# EAGLE schematic arduino shield (1) (EAGLE 7.4.0)
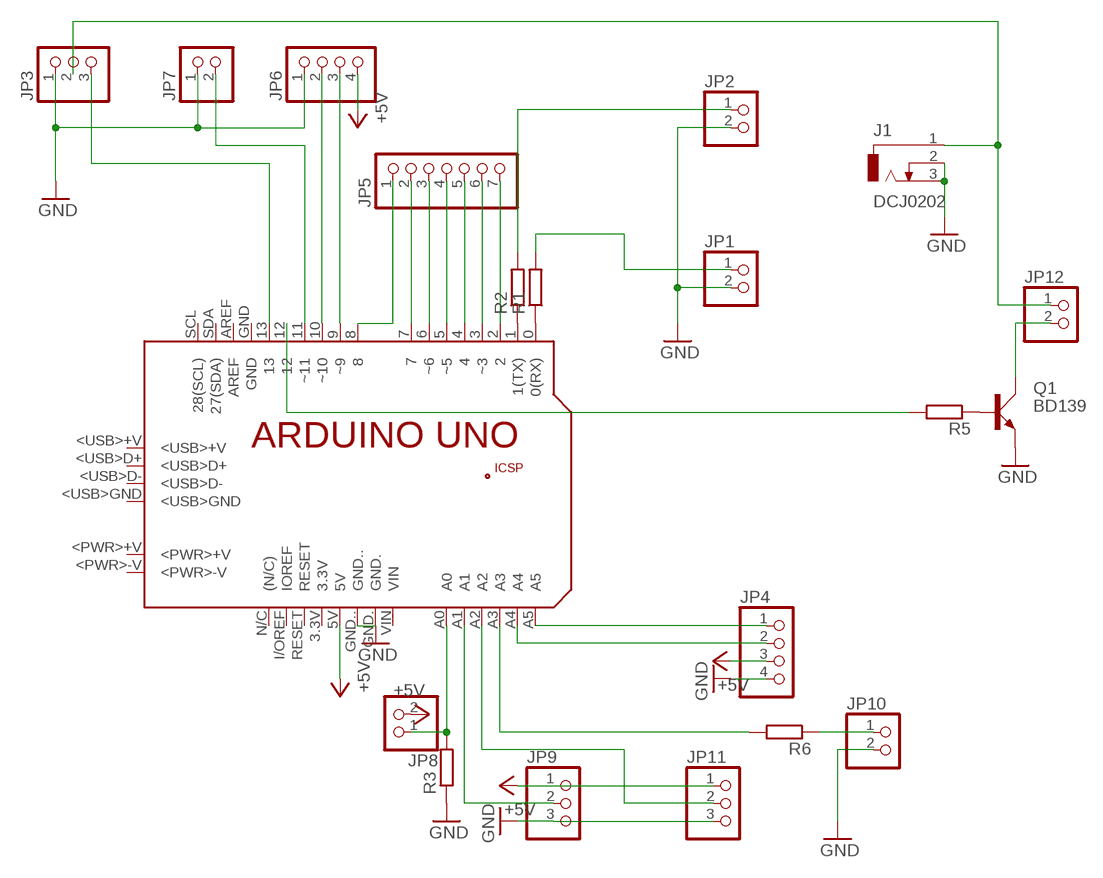
[diagram p0: schematic, sheet 1]

## Parts
J1  DCJ0202  [DCJ0202]
JP1  PINHD-1X2  [1X02]
JP2  PINHD-1X2  [1X02]
JP3  PINHD-1X3  [1X03]
JP4  PINHD-1X4  [1X04]
JP5  PINHD-1X7  [1X07]
JP6  PINHD-1X4  [1X04]
JP7  PINHD-1X2  [1X02]
JP8  PINHD-1X2  [1X02]
JP9  PINHD-1X3  [1X03]
JP10  PINHD-1X2  [1X02]
JP11  PINHD-1X3  [1X03]
JP12  PINHD-1X2  [1X02]
PCB1  ARDUINO_UNO  [ARDUINO_UNO]
Q1  BD139  [TO126AV]
R1  R-EU_0207/7  [0207/7]
R2  R-EU_0207/7  [0207/7]
R3  R-EU_0207/7  [0207/7]
R5  R-EU_0207/7  [0207/7]
R6  R-EU_0207/7  [0207/7]

## Nets
+5V: JP4.3 JP6.4 JP8.2 JP9.1 JP11.1 PCB1.5V
GND: J1.2 J1.3 JP1.2 JP2.2 JP3.1 JP4.4 JP6.1 JP7.1 JP9.3 JP10.2 JP11.3 PCB1.GND. PCB1.GND.. Q1.E R3.1
N$1: PCB1.0(0(RX)) R1.1
N$2: PCB1.1(1(TX)) R2.1
N$3: JP5.7 PCB1.2
N$4: JP5.6 PCB1.3(~3)
N$5: JP5.5 PCB1.4
N$6: JP5.4 PCB1.5(~5)
N$7: JP5.3 PCB1.6(~6)
N$8: JP5.2 PCB1.7
N$9: JP5.1 PCB1.8
N$10: JP1.1 R1.2
N$11: JP2.1 R2.2
N$12: JP10.1 R6.1
N$13: JP6.3 PCB1.9(~9)
N$14: JP6.2 PCB1.10(~10)
N$15: JP7.2 PCB1.11(~11)
N$16: JP3.3 PCB1.13
N$17: J1.1 JP3.2 JP12.1
N$19: JP8.1 PCB1.A0 R3.2
N$20: JP4.1 PCB1.A5
N$21: JP4.2 PCB1.A4
N$22: JP9.2 PCB1.A1
N$23: PCB1.A3 R6.2
N$25: JP11.2 PCB1.A2
N$26: Q1.B R5.1
N$27: JP12.2 Q1.C
N$28: PCB1.12 R5.2
Unconnected: PCB1.3.3V PCB1.+5V PCB1.<PWR>+V PCB1.<PWR>-V PCB1.<USB>+V PCB1.<USB>D+ PCB1.<USB>D- PCB1.<USB>GND PCB1.AREF PCB1.GND PCB1.GND_ PCB1.I/OREF(IOREF) PCB1.MISO PCB1.MOSI PCB1.N/C((N/C)) PCB1.RESET PCB1.RESET. PCB1.SCK PCB1.SCL(28(SCL)) PCB1.SDA(27(SDA)) PCB1.VIN

## Library data of the parts
J1 = con-jack:DCJ0202: DC POWER JACK Source: DCJ0202.pdf; OC_FARNELL: unknown; OC_NEWARK: unknown
JP1 JP2 JP7 JP8 JP10 JP12 = pinhead:PINHD-1X2: PIN HEADER
JP3 JP9 JP11 = pinhead:PINHD-1X3: PIN HEADER
JP4 JP6 = pinhead:PINHD-1X4: PIN HEADER
JP5 = pinhead:PINHD-1X7: PIN HEADER
PCB1 = E14_Arduino_revC:ARDUINO_UNO: Device for representing an Arduino Uno board with a footprint in an EAGLE design. Created by Dave Young for Element14. More EAGLE documentation at: http://www.element14.com/community/community/knode/cadsoft_eagle
Q1 = transistor-power:BD139: NPN TRANSISTOR
R1-R3 R5 R6 = rcl:R-EU_: RESISTOR, European symbol